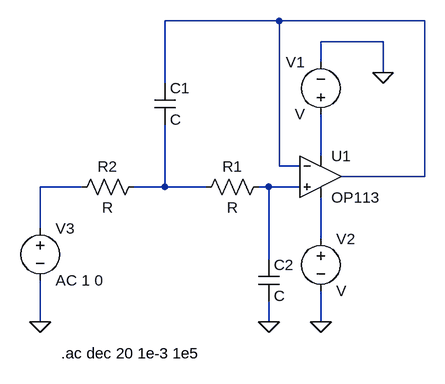
[diagram p0: schematic BW4.asc]
BW4.asc, the LTspice schematic file:
Version 4.1
SHEET 1 880 680
WIRE 176 -64 0 -64
WIRE 400 -64 176 -64
WIRE 336 -32 240 -32
WIRE 240 0 240 -32
WIRE 336 16 336 -32
WIRE 0 32 0 -64
WIRE 240 144 240 80
WIRE 176 160 176 -64
WIRE 208 160 176 160
WIRE 400 176 400 -64
WIRE 400 176 272 176
WIRE -128 192 -192 192
WIRE 0 192 0 96
WIRE 0 192 -48 192
WIRE 64 192 0 192
WIRE 160 192 144 192
WIRE 208 192 160 192
WIRE -192 256 -192 192
WIRE 240 272 240 208
WIRE 160 304 160 192
WIRE -192 400 -192 336
WIRE 160 400 160 368
WIRE 240 400 240 352
FLAG 336 16 0
FLAG 240 400 0
FLAG -192 400 0
FLAG 160 400 0
SYMBOL OpAmps\\OP113 240 112 R0
SYMATTR InstName U1
SYMBOL voltage 240 96 R180
WINDOW 0 24 96 Left 2
WINDOW 3 24 16 Left 2
SYMATTR InstName V1
SYMBOL voltage 240 256 R0
SYMATTR InstName V2
SYMBOL res 160 176 R90
WINDOW 0 0 56 VBottom 2
WINDOW 3 32 56 VTop 2
SYMATTR InstName R1
SYMBOL res -32 176 R90
WINDOW 0 0 56 VBottom 2
WINDOW 3 32 56 VTop 2
SYMATTR InstName R2
SYMBOL voltage -192 240 R0
WINDOW 123 0 0 Left 0
WINDOW 39 0 0 Left 0
SYMATTR InstName V3
SYMATTR Value AC 1 0
SYMBOL cap -16 32 R0
SYMATTR InstName C1
SYMBOL cap 144 304 R0
SYMATTR InstName C2
TEXT -160 448 Left 2 !.ac dec 20 1e-3 1e5

The netlist it stands for:
* BW4.asc
X§U1 N005 N001 N002 N006 N001 OP113  ; pins In+ In- V+ V- OUT
V1 N002 0 V
V2 N006 0 V
R1 N005 N004 R
R2 N004 N003 R
V3 N003 0 AC 1 0
C1 N001 N004 C
C2 N005 0 C
.ac dec 20 1e-3 1e5
.lib ADI.lib
.backanno
.end